# Altium project Camera-Controller-Board.PrjPcb (part 4 of 18)
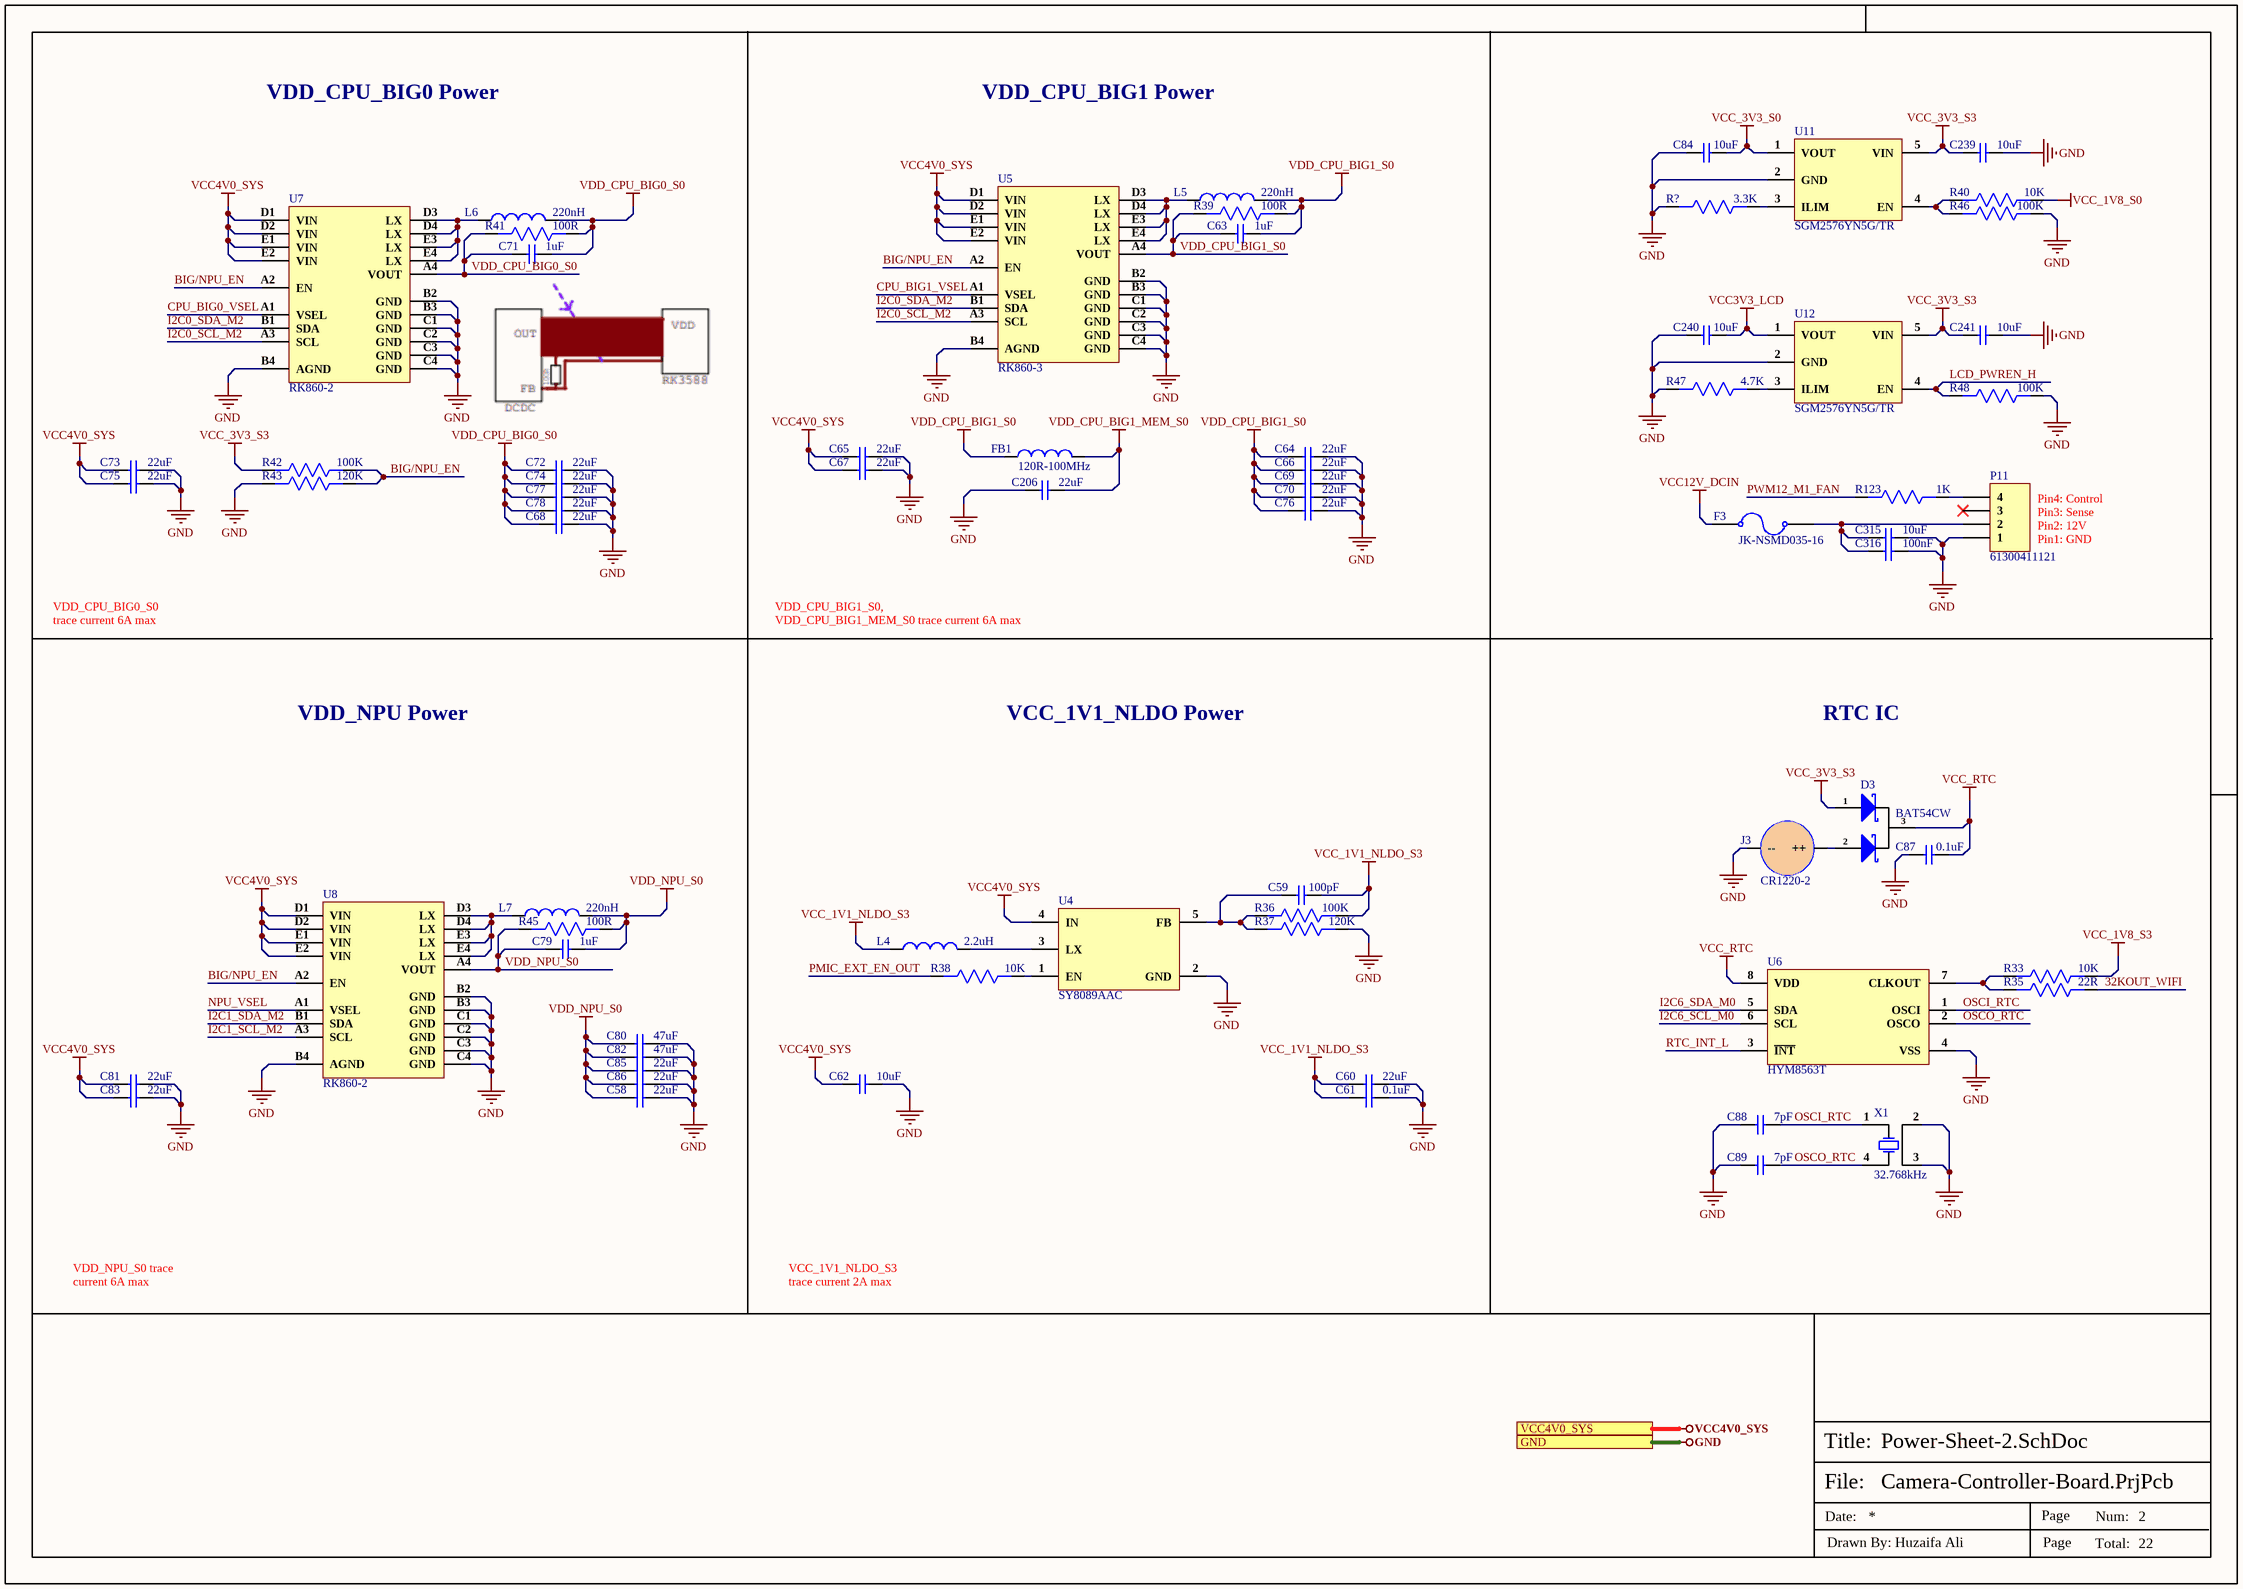
[diagram p105: Power-Sheet-2.SchDoc]

## Sheet Power-Sheet-2.SchDoc (continued)

### Nets
GND: C58.2 C60.2 C61.2 C62.2 C64.2 C65.2 C66.2 C67.2 C68.2 C69.2 C70.2 C72.2 C73.2 C74.2 C75.2 C76.2 C77.2 C78.2 C80.2 C81.2 C82.2 C83.2 C84.1 C85.2 C86.2 C87.1 C88.1 C89.1 C206.1 C239.2 C240.1 C241.2 C315.2 C316.2 J3.2(--) P11.1 R37.1 R43.2 R46.1 R47.2 R48.1 R?#1.2 U4.2(GND) U5.B2(GND) U5.B3(GND) U5.B4(AGND) U5.C1(GND) U5.C2(GND) U5.C3(GND) U5.C4(GND) U6.4(VSS) U7.B2(GND) U7.B3(GND) U7.B4(AGND) U7.C1(GND) U7.C2(GND) U7.C3(GND) U7.C4(GND) U8.B2(GND) U8.B3(GND) U8.B4(AGND) U8.C1(GND) U8.C2(GND) U8.C3(GND) U8.C4(GND) U11.2(GND) U12.2(GND) X1.2 X1.3 ; port GND
VCC3V3_LCD: C240.2 U12.1(VOUT)
VCC4V0_SYS: C62.1 C65.1 C67.1 C73.1 C75.1 C81.1 C83.1 U4.4(IN) U5.D1(VIN) U5.D2(VIN) U5.E1(VIN) U5.E2(VIN) U7.D1(VIN) U7.D2(VIN) U7.E1(VIN) U7.E2(VIN) U8.D1(VIN) U8.D2(VIN) U8.E1(VIN) U8.E2(VIN) ; port VCC4V0_SYS
VCC12V_DCIN: F3.1
VCC_1V1_NLDO_S3: C59.2 C60.1 C61.1 L4.1 R36.1
VCC_1V8_S0: R40.1
VCC_1V8_S3: R33.1
VCC_3V3_S0: C84.2 U11.1(VOUT)
VCC_3V3_S3: C239.1 C241.1 D3.1(A1) R42.2 U11.5(VIN) U12.5(VIN)
VCC_RTC: C87.2 D3.3(K) U6.8(VDD)
VDD_CPU_BIG0_S0: C68.1 C71.1 C71.2 C72.1 C74.1 C77.1 C78.1 L6.2 R41.1 R41.2 U7.A4(VOUT)
VDD_CPU_BIG1_MEM_S0: C206.2 FB1.2
VDD_CPU_BIG1_S0: C63.1 C63.2 C64.1 C66.1 C69.1 C70.1 C76.1 FB1.1 L5.2 R39.1 R39.2 U5.A4(VOUT)
VDD_NPU_S0: C58.1 C79.1 C79.2 C80.1 C82.1 C85.1 C86.1 L7.2 R45.1 R45.2 U8.A4(VOUT)
32KOUT_WIFI: R35.1
BIG/NPU_EN: R42.1 R43.1 U5.A2(EN) U7.A2(EN) U8.A2(EN)
CPU_BIG0_VSEL: U7.A1(VSEL)
CPU_BIG1_VSEL: U5.A1(VSEL)
I2C0_SCL_M2: U5.A3(SCL) U7.A3(SCL)
I2C0_SDA_M2: U5.B1(SDA) U7.B1(SDA)
I2C1_SCL_M2: U8.A3(SCL)
I2C1_SDA_M2: U8.B1(SDA)
I2C6_SCL_M0: U6.6(SCL)
I2C6_SDA_M0: U6.5(SDA)
LCD_PWREN_H: R48.2 U12.4(EN)
NPU_VSEL: U8.A1(VSEL)
OSCI_RTC: C88.2 U6.1(OSCI) X1.1(OSC1)
OSCO_RTC: C89.2 U6.2(OSCO) X1.4(OSC2)
PMIC_EXT_EN_OUT: R38.2
PWM12_M1_FAN: R123.2
RTC_INT_L: U6.3(~{INT})
NetC59_1: C59.1 R36.2 R37.2 U4.5(FB)
NetC315_1: C315.1 C316.1 F3.2 P11.2
NetD3_2: D3.2(A2) J3.1(++)
NetL4_2: L4.2 U4.3(LX)
NetL5_1: L5.1 U5.D3(LX) U5.D4(LX) U5.E3(LX) U5.E4(LX)
NetL6_1: L6.1 U7.D3(LX) U7.D4(LX) U7.E3(LX) U7.E4(LX)
NetL7_1: L7.1 U8.D3(LX) U8.D4(LX) U8.E3(LX) U8.E4(LX)
NetP11_4: P11.4 R123.1
NetR33_2: R33.2 R35.2 U6.7(CLKOUT)
NetR38_1: R38.1 U4.1(EN)
NetR40_2: R40.2 R46.2 U11.4(EN)
NetR47_1: R47.1 U12.3(ILIM)
NetR?#1_1: R?#1.1 U11.3(ILIM)

Not connected (* = marked no-connect by the designer): J3 MH1 MH2; P11 3*

### Notes on the sheet
- VDD_CPU_BIG0 Power
- VDD_CPU_BIG1 Power
- (near P11) Pin4: Control
  Pin3: Sense
  Pin2: 12V
  Pin1: GND
- VDD_CPU_BIG0_S0 trace current 6A max
- VDD_CPU_BIG1_S0, VDD_CPU_BIG1_MEM_S0 trace current 6A max
- VDD_NPU Power
- VCC_1V1_NLDO Power
- RTC IC
- VDD_NPU_S0 trace current 6A max
- VCC_1V1_NLDO_S3 trace current 2A max
- File:
- Title:
- Date:
- Page
- Num:
- Total:
- Drawn By: Huzaifa Ali